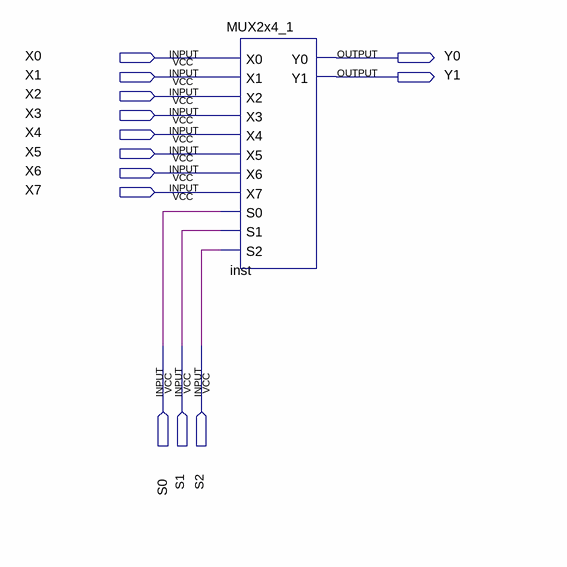
[diagram p0: schematic sheet]
// Quartus schematic MUX8_1.bdf as structural Verilog: 1 symbols, 13 pins
module MUX8_1 (
  input  X0,
  input  X1,
  input  X2,
  input  X3,
  input  X4,
  input  X5,
  input  X6,
  input  X7,
  input  S0,
  input  S1,
  input  S2,
  output Y0,
  output Y1
);

  MUX2x4_1 inst (
    .X0(X0), .X1(X1), .X2(X2), .X3(X3), .X4(X4), .X5(X5), .X6(X6), .X7(X7), .S0(S0), .S1(S1), .S2(S2),
    .Y0(Y0), .Y1(Y1));
endmodule
